# Altium project Electrode.PrjPcb
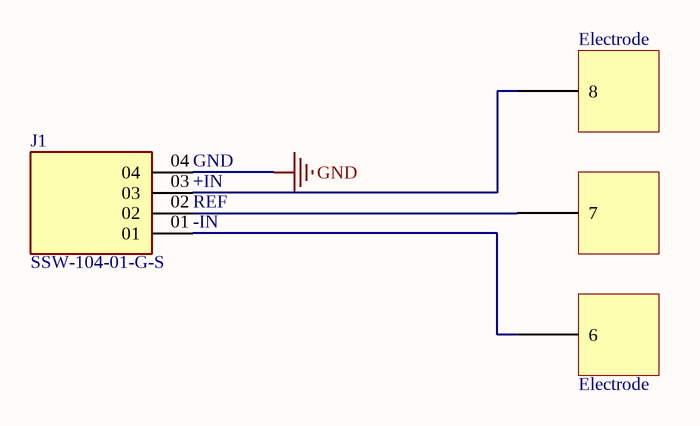
[diagram p0: electrode.SchDoc]
1 sheet, 2 parts. Net scope: global (net labels, ports and power ports of the same name join across sheets).
Board file: electrode.PcbDoc

## Sheet electrode.SchDoc
size A; SheetNumber: 1; SheetTotal: 1

### Parts
Electrode  Electrode  [Electrode]
J1  SSW-104-01-G-S  [SAMTEC_SSW-104-01-G-S]

### Nets
GND: J1.04
NetElectrode_6: Electrode.6 J1.01
NetElectrode_7: Electrode.7 J1.02
NetElectrode_8: Electrode.8 J1.03

### Notes on the sheet
- (near J1) +IN
- (near J1) REF
- (near J1) -IN
- (near J1) GND

### Library data of the parts
J1 = SSW-104-01-G-S: MF: Samtec; Package: None; Availability: Unavailable; Value: *; MP: SSW-104-01-G-S; Price: None